# Altium schematic sheet Power-Sheet.SchDoc (part 2 of 3)
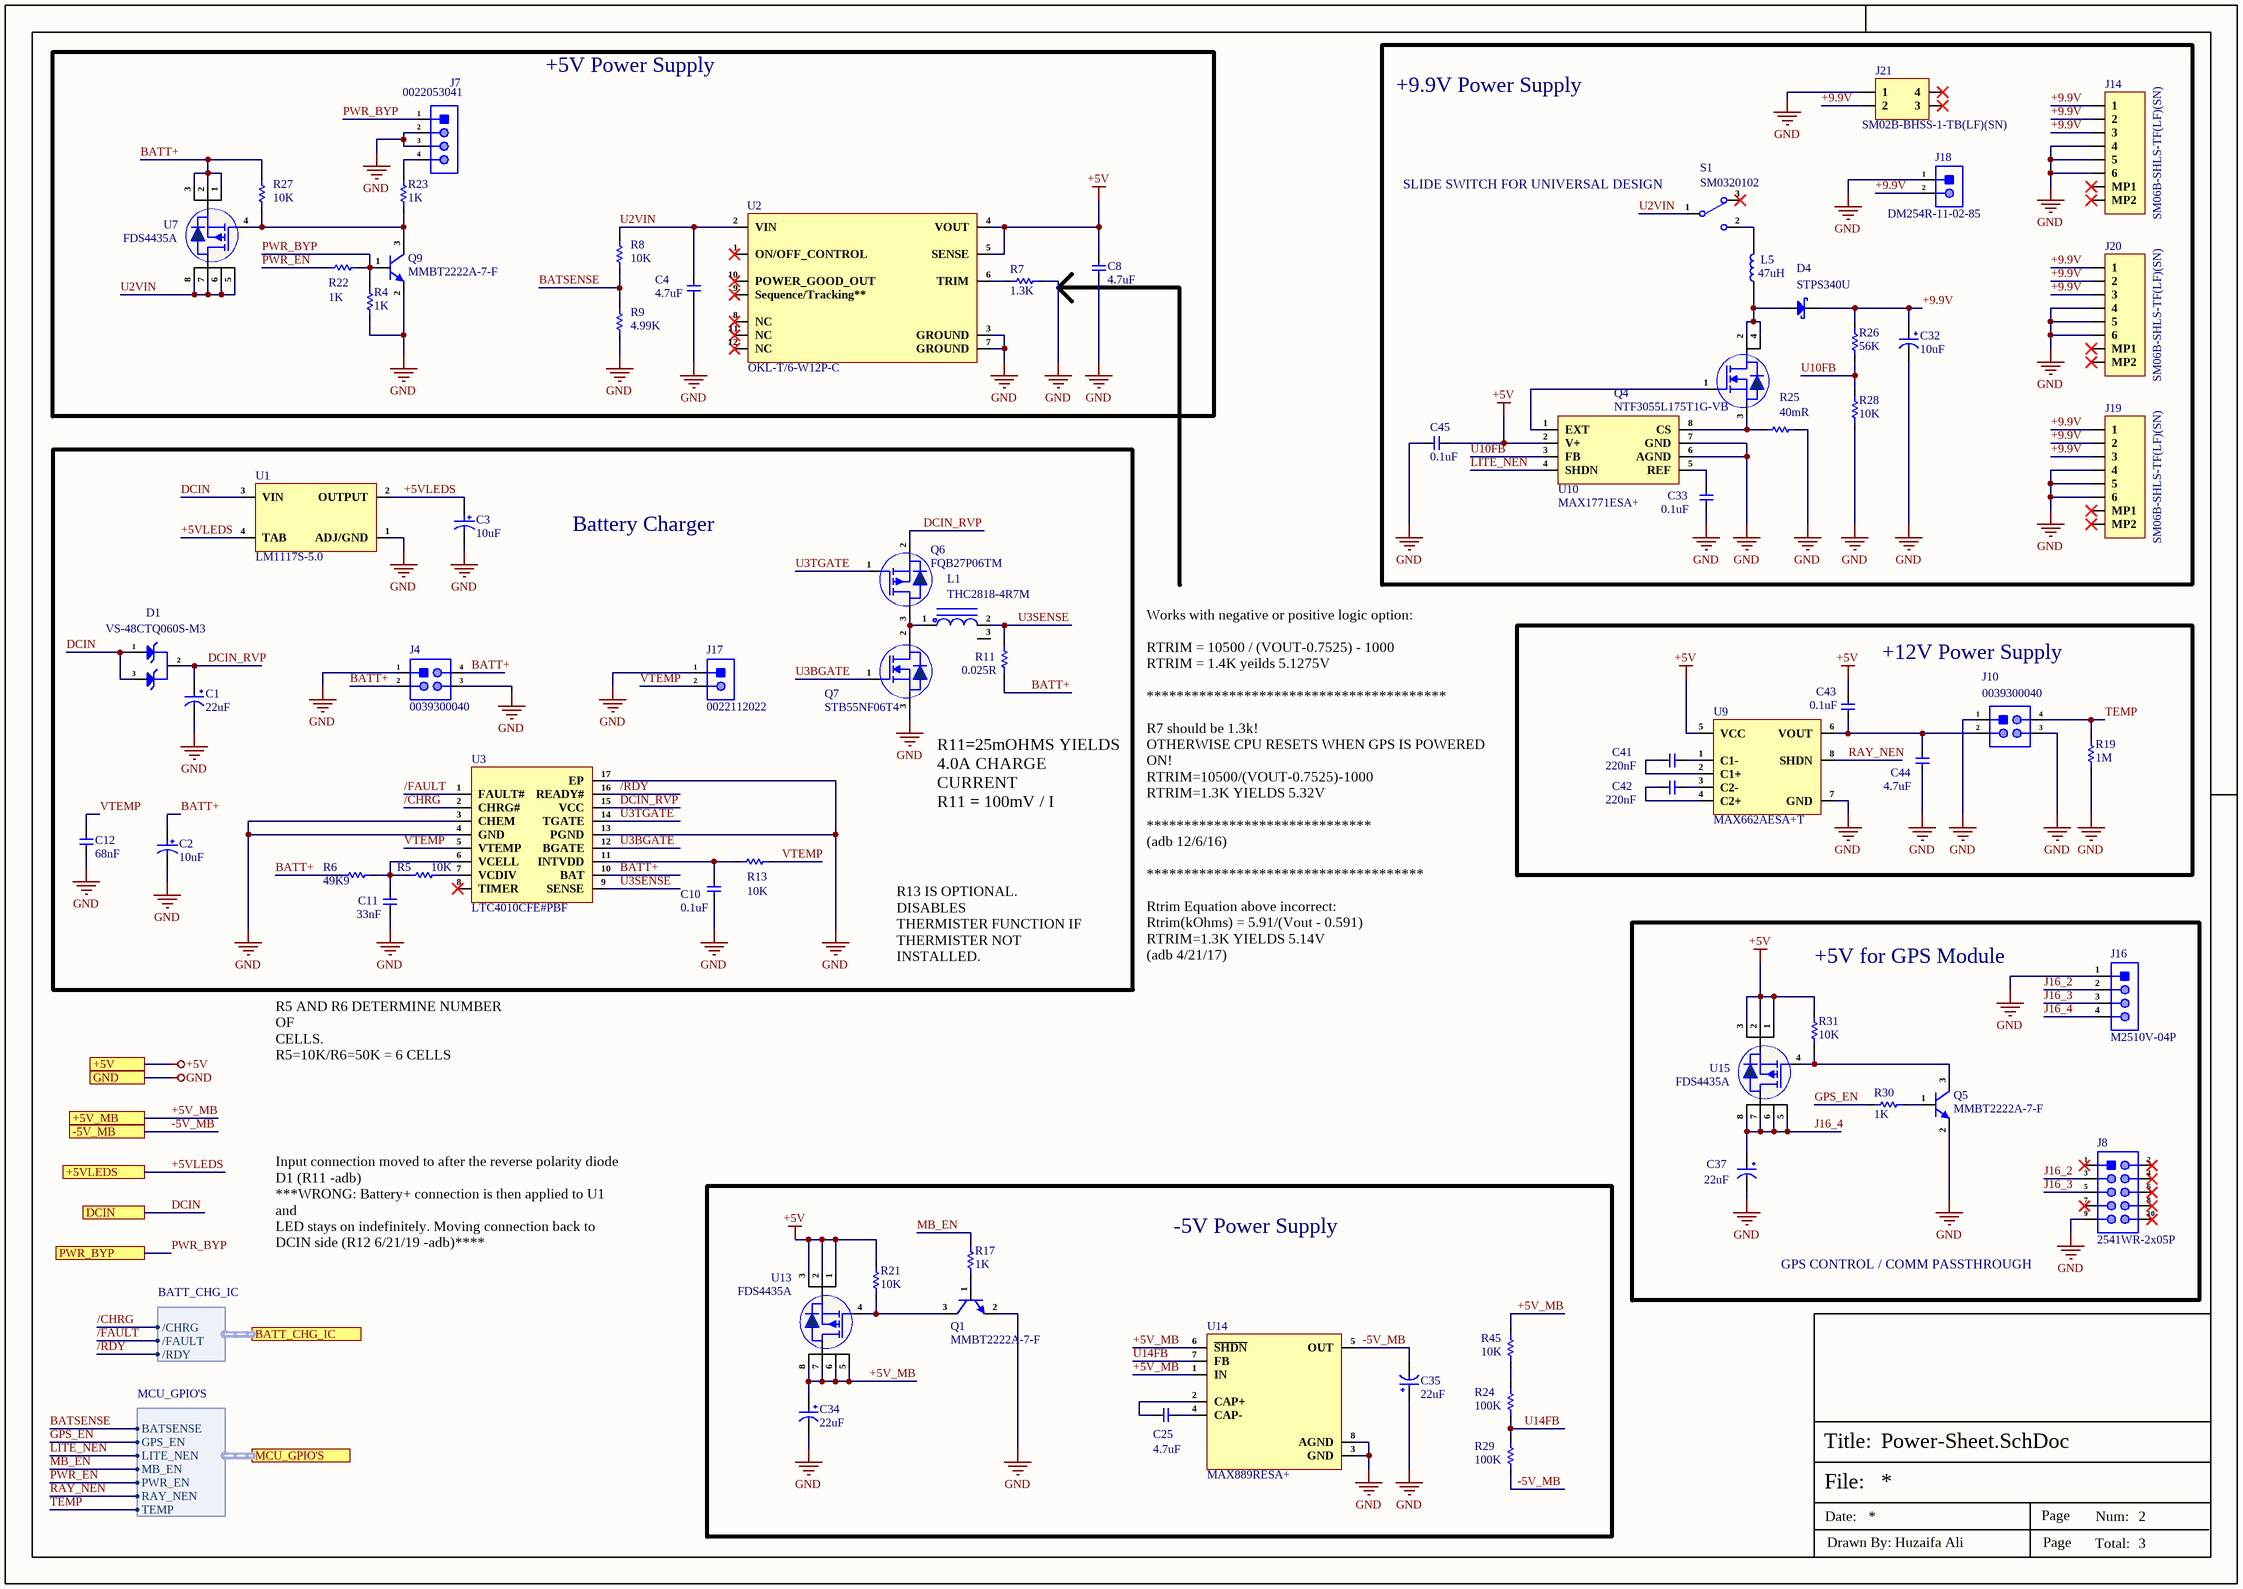
[diagram p1: Power-Sheet.SchDoc]
## Library data of the parts
C1 = TR3C226K025C0250: CAP TANT 22UF 10% 25V 2312; Manufacturer: Vishay Sprague; Item Type: Tantalum Capacitors; Supplier: Mouser; Supplier Part Number: 74-TR3C226K025C0250; Manufacturer Part Number: TR3C226K025C0250; RoHS: Yes; Stock: 217; Pricing: 1=1.45, 10=0.99, 50=0.99, 100=0.811, 1000=0.621, 10000=0.597 (USD); ComponentLink1URL: https://datasheet.ciiva.com/12911/tr3-239731-12911111.pdf?src-supplier=Mouser; ComponentLink1Description: https://datasheet.ciiva.com/12911/tr3-239731-12911111.pdf?src-supplier=Mouser; ComponentLink2URL: https://datasheet.ciiva.com/267/tr3-267103.pdf?src-supplier=Digikey; ComponentLink2Description: https://datasheet.ciiva.com/267/tr3-267103.pdf?src-supplier=Digikey; ComponentLink3URL: https://datasheet.ciiva.com/267/tr3-267104.pdf?src-supplier=Digikey; ComponentLink3Description: https://datasheet.ciiva.com/267/tr3-267104.pdf?src-supplier=Digikey; ComponentLink4URL: https://datasheet.ciiva.com/267/tr3-267105.pdf?src-supplier=Digikey; ComponentLink4Description: https://datasheet.ciiva.com/267/tr3-267105.pdf?src-supplier=Digikey; ComponentLink5URL: https://datasheet.ciiva.com/11299/tr3-11299414.pdf?src-supplier=Avnet; ComponentLink5Description: https://datasheet.ciiva.com/11299/tr3-11299414.pdf?src-supplier=Avnet; ComponentLink6URL: https://datasheet.ciiva.com/22731/1923401-22731838.pdf?src-supplier=Element14; ComponentLink6Description: https://datasheet.ciiva.com/22731/1923401-22731838.pdf?src-supplier=Element14; ComponentLink7URL: https://datasheet.ciiva.com/28445/1923401-28445770.pdf?src-supplier=Element14; ComponentLink7Description: https://datasheet.ciiva.com/28445/1923401-28445770.pdf?src-supplier=Element14
C2 C3 = CA45-B025K106T: 10uF 25V 2.5Ω@100kHz ±10% CASE-B-3528 Tantalum Capacitors ROHS; Manufacturer: Xiangyee in S&T; Manufacturer Part Number: CA45-B025K106T; ComponentLink1URL: https://www.lcsc.com/product-detail/Tantalum-Capacitors_Hunan-Xiangyee-in-S-T-CA45-B025K106T_C119050.html; ComponentLink1Description: LCSC; LCSC Part Number: C119050; Item Type: Capacitor; Package: Case-B
C4 C8 C25 C44 = C1608X5R1E475KT000E: CAP CER, 4.7 µF, 25 V, 0603; Manufacturer: TDK; Dielectric Material: Ceramic; Tolerance: 10%; Voltage Rating: 25V; Dielectric: X5R; Item Type: Capacitor; Supplier 1: Digi-Key; Manufacturer Part Number: C1608X5R1E475KT000E; RoHS: No; Supplier Part Number 1: 2220Y1000562GCT-ND; Supplier 2: RSComponents; Category: Ceramic Capacitors; Stock 2: 16120; Pricing 2: 100=0.23400, 200=0.21900, 1000=0.20700, 2000=0.18700 (GBP); Mount: Surface Mount; Case/Package: 0603; Weight: 7.1E-05oz; Case Code (Metric): 1608; Case Code (Imperial): 0603; Min Operating Temperature: -55°C; Max Operating Temperature: 85°C; Termination: SMD/SMT; Resistor Type: Ceramic; Packaging: Tape and Reel; Capacitance: 4.7uF; Package Quantity: 4000; Voltage Rating (DC): 25V; Length: 1.6mm; Width: 0.031inch; Height: 0.8mm; Thickness: 0.039inch; Depth: 0.8mm; Lead Free: Lead Free; REACH SVHC: No SVHC; ComponentLink1URL: https://datasheet.ciiva.com/48587/6print-detail-pdf-phplangenpart-noc1608x5r1e475k080acimp-unit-xmhz-48587141.pdf?src-supplier=Onlinecomponents.com; ComponentLink1Description: https://datasheet.ciiva.com/48587/6print-detail-pdf-phplangenpart-noc1608x5r1e475k080acimp-unit-xmhz-48587141.pdf?src-supplier=Onlinecomponents.com; ComponentLink2URL: https://datasheet.ciiva.com/24216/mlcc-commercial-general-en-24216326.pdf?src-supplier=Mouser; ComponentLink2Description: https://datasheet.ciiva.com/24216/mlcc-commercial-general-en-24216326.pdf?src-supplier=Mouser; ComponentLink3URL: https://datasheet.ciiva.com/48671/mlcc-commercial-general-en-48671304.pdf?src-supplier=Avnet; ComponentLink3Description: https://datasheet.ciiva.com/48671/mlcc-commercial-general-en-48671304.pdf?src-supplier=Avnet; Supplier Part Number 2: 9159158P; LCSC Part Number: C76615
C10 C33 C43 C45 = CC0603KRX7R0BB104: CAP CER 0.1UF 100V X7R 0603; Manufacturer: Yageo; Capacitance: 100nF; Tolerance: 10%; Item Type: Capacitor; Supplier 1: Digi-Key; Manufacturer Part Number: CC0603KRX7R0BB104; RoHS: Yes; Category: Ceramic Capacitors; Stock 1: 60476; Pricing 1: 1=0.19000, 10=0.13500, 50=0.07680, 100=0.06370, 500=0.04466, 1000=0.03696 (USD); Mount: Surface Mount; Case/Package: 0603; Case Code (Metric): 1608; Case Code (Imperial): 0603; Weight: 7.1E-05oz; Min Operating Temperature: -55°C; Max Operating Temperature: 125°C; Package Quantity: 4000; Voltage Rating: 100V; Packaging: Tape and Reel; Dielectric: X7R; Termination: SMD/SMT; Resistor Type: Ceramic; Voltage Rating (DC): 100V; Series: CC; Length: 0.063inch; Width: 0.031inch; Thickness: 0.035inch; Depth: 0.8mm; Lead Free: Lead Free; RoHS Compliant: Yes; ComponentLink1URL: https://datasheet.ciiva.com/6277/mlccorderingcode-6277030.pdf?src-supplier=Digi-Key; ComponentLink1Description: https://datasheet.ciiva.com/6277/mlccorderingcode-6277030.pdf?src-supplier=Digi-Key; ComponentLink2URL: https://datasheet.ciiva.com/6277/mlccorderingcode-6277081.pdf?src-supplier=Digi-Key; ComponentLink2Description: https://datasheet.ciiva.com/6277/mlccorderingcode-6277081.pdf?src-supplier=Digi-Key; ComponentLink3URL: https://datasheet.ciiva.com/6277/mlccorderingcode-6277082.pdf?src-supplier=Digi-Key; ComponentLink3Description: https://datasheet.ciiva.com/6277/mlccorderingcode-6277082.pdf?src-supplier=Digi-Key; Supplier Part Number 1: 311-1523-1-ND; LCSC Part Number: C113803
C11 = CL10B333KB8NNNC: CAP CER 0.033UF 50V X7R 0603; Manufacturer: Samsung; Material: Ceramic; Tolerance: 10%; Supplier: Avnet; Supplier Part Number: CL10B333KB8NNNC; Manufacturer Part Number: CL10B333KB8NNNC; RoHS: Yes; Category: Capacitors; Stock: 128000; Pricing: 4000=0.0055, 8000=0.00537, 16000=0.00525, 24000=0.00512, 32000=0.00499 (USD); Mounting Technology: Surface Mount; Case/Package: 0603; Case Code (Metric): 1608; Case Code (Imperial): 0603; Min Operating Temperature: -55°C; Max Operating Temperature: 125°C; Value: 33nF; Packaging: Tape and Reel; Package Quantity: 1; Voltage Rating: 50V; Dielectric: X7R; Series: CL; Construction: Flat; Voltage: 50V; Voltage Rating (DC): 50V; Length: 1.6mm; Width: 0.031inch; Height: 0.8mm; Thickness: 0.035inch; Depth: 0.8mm; Radiation Hardening: No; RoHS Compliant: Yes; ComponentLink1URL: https://datasheet.ciiva.com/15195/getdatasheetpartid-359558-15195751.pdf?src-supplier=Verical; ComponentLink1Description: https://datasheet.ciiva.com/15195/getdatasheetpartid-359558-15195751.pdf?src-supplier=Verical; ComponentLink2URL: https://datasheet.ciiva.com/29198/457066-da-01-en-vs-kondensator-0603-29198738.pdf?src-supplier=Conrad; ComponentLink2Description: https://datasheet.ciiva.com/29198/457066-da-01-en-vs-kondensator-0603-29198738.pdf?src-supplier=Conrad; ComponentLink3URL: https://datasheet.ciiva.com/16500/cl05b104kq5nnnc-16500696.pdf?src-supplier=Future+Electronics; ComponentLink3Description: https://datasheet.ciiva.com/16500/cl05b104kq5nnnc-16500696.pdf?src-supplier=Future+Electronics; ComponentLink4URL: https://datasheet.ciiva.com/26310/mlcc-catalogdownload2013-eng-26310287.pdf?src-supplier=Distrelec; ComponentLink4Description: https://datasheet.ciiva.com/26310/mlcc-catalogdownload2013-eng-26310287.pdf?src-supplier=Distrelec
C12 = CC0603KRX7R9BB683: CAP CER 0.068UF 50V X7R 0603; Manufacturer: Yageo; Item Type: Capacitors; Material: 4241ConductorMaterial; Tolerance: 10%; Supplier: Future Electronics; Supplier Part Number: 3015344; Manufacturer Part Number: CC0603KRX7R9BB683; RoHS: Yes; Stock: 52000; Pricing: 4000=0.0058, 16000=0.0055, 60000=0.0052, 160000=0.005, 400000=0.0047 (USD); Mounting Technology: Surface Mount; Case/Package: 0603; Case Code (Imperial): 0603; Case Code (Metric): 1608; Weight: 7.1E-05oz; Min Operating Temperature: -55°C; Max Operating Temperature: 125°C; Value: 68nF; Voltage Rating (DC): 50V; Packaging: Tape and Reel; Voltage Rating: 50V; Dielectric: X7R; Termination: SMD/SMT; Series: CC; Length: 0.063inch; Width: 0.031inch; Thickness: 0.035inch; Lead Free: Lead Free; Halogen Free: Halogen Free; RoHS Compliant: Yes; ComponentLink1URL: http://www.mouser.com/ds/2/447/Yageo_UPY-GP_NP0_16V-to-50V_9-358835.pdf?src-supplier=Mouser; ComponentLink1Description: http://www.mouser.com/ds/2/447/Yageo_UPY-GP_NP0_16V-to-50V_9-358835.pdf?src-supplier=Mouser; ComponentLink2URL: https://datasheet.octopart.com/CC0603KRX7R9BB683-Yageo-datasheet-166511530.pdf?src-supplier=Future+Electronics; ComponentLink2Description: https://datasheet.octopart.com/CC0603KRX7R9BB683-Yageo-datasheet-166511530.pdf?src-supplier=Future+Electronics; ComponentLink3URL: http://www.yageo.com/documents/recent/UPY-GPHC_X7R_6.3V-to-50V_18.pdf?src-supplier=Digikey; ComponentLink3Description: http://www.yageo.com/documents/recent/UPY-GPHC_X7R_6.3V-to-50V_18.pdf?src-supplier=Digikey; ComponentLink4URL: https://www.yageo.com/upload/media/product/productsearch/datasheet/mlcc/UPY-GPHC_X7R_6.3V-to-50V_18.pdf?src-supplier=Digikey; ComponentLink4Description: https://www.yageo.com/upload/media/product/productsearch/datasheet/mlcc/UPY-GPHC_X7R_6.3V-to-50V_18.pdf?src-supplier=Digikey; ComponentLink5URL: https://datasheet.octopart.com/CC0603KRX7R9BB683-Yageo-datasheet-140260305.pdf?src-supplier=Newark; ComponentLink5Description: https://datasheet.octopart.com/CC0603KRX7R9BB683-Yageo-datasheet-140260305.pdf?src-supplier=Newark; ComponentLink6URL: http://www.yageo.com/documents/recent/UPY-GPHC_X7R_6.3V-to-50V_9.pdf?src-supplier=Future+Electronics; ComponentLink6Description: http://www.yageo.com/documents/recent/UPY-GPHC_X7R_6.3V-to-50V_9.pdf?src-supplier=Future+Electronics; LCSC Part Number: C107098
C32 = TAJC106K035RNJ: CAP TANT 10UF 10% 35V 2312; Manufacturer: Kyocera AVX; Item Type: Tantalum Capacitors; Dielectric Material: Tantalum; Tolerance: 20%; ESR (Equivalent Series Resistance): 1.6R; Leakage Current: 3.5uA; Polarity: Polar; Voltage: 25V; Dissipation Factor: 6%; Life (Hours): 2000Hour; Ripple Current: 262mA; Supplier: Avnet; Supplier Part Number: TAJC106K035RNJ; Manufacturer Part Number: TAJC106K035RNJ; RoHS: Yes; Stock: 20000; Pricing: 500=0.4611, 1000=0.4505, 2000=0.4399, 3000=0.4293, 4000=0.4187, 5000=0.4081, 50000=0.4028 (USD); Mounting Technology: Surface Mount,PCB; Case/Package: Molded; Pins: 2; Case Code (Imperial): 2312; Case Code (Metric): 6032; Min Operating Temperature: -55°C; Max Operating Temperature: 125°C; Value: 10uF; Voltage Rating (DC): 35V; Voltage Rating: 35V; Features: General Purpose; Series: TAJ; Packaging: Tape and Reel; Package Quantity: 500; Termination: SMD/SMT; Construction: Flat; Length: 6mm; Width: 3.2mm; Height: 2.6mm; Depth: 3.2mm; Radiation Hardening: No; Lead Free: Lead Free; RoHS Compliant: Yes; Reach SVHC Compliant: No; ComponentLink1URL: https://datasheet.ciiva.com/11793/0900766b80ccdc61-11793205.pdf?src-supplier=Rs; ComponentLink1Description: https://datasheet.ciiva.com/11793/0900766b80ccdc61-11793205.pdf?src-supplier=Rs; ComponentLink2URL: https://datasheet.ciiva.com/26341/559442-da-01-en-tacc-c-6-0-mm-x-3-2-mm-x-2-6-mm-10-uf-26341782.pdf?src-supplier=Conrad; ComponentLink2Description: https://datasheet.ciiva.com/26341/559442-da-01-en-tacc-c-6-0-mm-x-3-2-mm-x-2-6-mm-10-uf-26341782.pdf?src-supplier=Conrad; ComponentLink3URL: https://datasheet.ciiva.com/5937/taj-5937099.pdf?src-supplier=Farnell; ComponentLink3Description: https://datasheet.ciiva.com/5937/taj-5937099.pdf?src-supplier=Farnell; ComponentLink4URL: https://datasheet.ciiva.com/7730/taj-7730983.pdf?src-supplier=Element14; ComponentLink4Description: https://datasheet.ciiva.com/7730/taj-7730983.pdf?src-supplier=Element14; ComponentLink5URL: https://datasheet.ciiva.com/7730/1703059-7730751.pdf?src-supplier=Element14; ComponentLink5Description: https://datasheet.ciiva.com/7730/1703059-7730751.pdf?src-supplier=Element14; ComponentLink6URL: https://datasheet.ciiva.com/7730/1703059-7730750.pdf?src-supplier=Element14; ComponentLink6Description: https://datasheet.ciiva.com/7730/1703059-7730750.pdf?src-supplier=Element14; ComponentLink7URL: https://datasheet.ciiva.com/7730/1680476-7730748.pdf?src-supplier=Element14; ComponentLink7Description: https://datasheet.ciiva.com/7730/1680476-7730748.pdf?src-supplier=Element14; ComponentLink8URL: https://datasheet.ciiva.com/7730/13070-7730749.pdf?src-supplier=Element14; ComponentLink8Description: https://datasheet.ciiva.com/7730/13070-7730749.pdf?src-supplier=Element14; ComponentLink9URL: https://datasheet.ciiva.com/264/taj-264350.pdf?src-supplier=Digikey; ComponentLink9Description: https://datasheet.ciiva.com/264/taj-264350.pdf?src-supplier=Digikey; ComponentLink10URL: https://datasheet.ciiva.com/264/taj-264349.pdf?src-supplier=Digikey; ComponentLink10Description: https://datasheet.ciiva.com/264/taj-264349.pdf?src-supplier=Digikey; ComponentLink11URL: https://datasheet.ciiva.com/264/taj-264351.pdf?src-supplier=Digikey; ComponentLink11Description: https://datasheet.ciiva.com/264/taj-264351.pdf?src-supplier=Digikey; ComponentLink12URL: https://datasheet.ciiva.com/12911/taj-27497-12911561.pdf?src-supplier=Mouser; ComponentLink12Description: https://datasheet.ciiva.com/12911/taj-27497-12911561.pdf?src-supplier=Mouser; ComponentLink13URL: https://datasheet.ciiva.com/14590/70001050-14590313.pdf?src-supplier=Allied+Electronics; ComponentLink13Description: https://datasheet.ciiva.com/14590/70001050-14590313.pdf?src-supplier=Allied+Electronics; ComponentLink14URL: https://datasheet.ciiva.com/3004/taj-3004476.pdf?src-supplier=Avnet; ComponentLink14Description: https://datasheet.ciiva.com/3004/taj-3004476.pdf?src-supplier=Avnet; ComponentLink15URL: https://datasheet.ciiva.com/15163/getdatasheetpartid-110753-15163367.pdf?src-supplier=Verical; ComponentLink15Description: https://datasheet.ciiva.com/15163/getdatasheetpartid-110753-15163367.pdf?src-supplier=Verical; ComponentLink16URL: https://datasheet.ciiva.com/3004/taj-3004475.pdf?src-supplier=Avnet; ComponentLink16Description: https://datasheet.ciiva.com/3004/taj-3004475.pdf?src-supplier=Avnet; LCSC Part Number: C7211
C34 C35 C37 = TAJB226K016RNJ: CAP TANT 22UF 10% 16V 1411; Manufacturer: Kyocera AVX; Item Type: Tantalum Capacitor; Manufacturer Part Number: TAJB226K016RNJ; Package: CASE-B-3528; LCSC Part Number: C8020; ComponentLink1Description: LCSC; ComponentLink1URL: https://www.lcsc.com/product-detail/Tantalum-Capacitors_Kyocera-AVX-TAJB226K016RNJ_C8020.html
C41 C42 = CC0603KRX7R6BB224: CAP CER 0.22UF 10V X7R 0603; Manufacturer: Yageo; Item Type: Capacitor; Supplier: Future Electronics; Supplier Part Number: 4740247; Manufacturer Part Number: CC0603KRX7R6BB224; RoHS: Yes; Category: Ceramic Capacitors; Stock: 892000; Pricing: 4000=0.0074, 16000=0.0071, 60000=0.0067, 100000=0.0066, 200000=0.0062 (USD); ComponentLink1URL: https://datasheet.ciiva.com/11786/0900766b80ce67ed-11786433.pdf?src-supplier=Rs; ComponentLink1Description: https://datasheet.ciiva.com/11786/0900766b80ce67ed-11786433.pdf?src-supplier=Rs; ComponentLink2URL: https://datasheet.ciiva.com/15189/getdatasheetpartid-93657-15189159.pdf?src-supplier=Verical; ComponentLink2Description: https://datasheet.ciiva.com/15189/getdatasheetpartid-93657-15189159.pdf?src-supplier=Verical; ComponentLink3URL: https://datasheet.ciiva.com/144/mlccorderingcode-144664.pdf?src-supplier=Digi-Key; ComponentLink3Description: https://datasheet.ciiva.com/144/mlccorderingcode-144664.pdf?src-supplier=Digi-Key; ComponentLink4URL: https://datasheet.ciiva.com/144/mlccorderingcode-144665.pdf?src-supplier=Digi-Key; ComponentLink4Description: https://datasheet.ciiva.com/144/mlccorderingcode-144665.pdf?src-supplier=Digi-Key; ComponentLink5URL: https://datasheet.ciiva.com/144/mlccorderingcode-144666.pdf?src-supplier=Digi-Key; ComponentLink5Description: https://datasheet.ciiva.com/144/mlccorderingcode-144666.pdf?src-supplier=Digi-Key; ComponentLink6URL: https://datasheet.ciiva.com/8033/1489800-8033791.pdf?src-supplier=Element14; ComponentLink6Description: https://datasheet.ciiva.com/8033/1489800-8033791.pdf?src-supplier=Element14; ComponentLink7URL: https://datasheet.ciiva.com/7978/1489800-7978173.pdf?src-supplier=Element14; ComponentLink7Description: https://datasheet.ciiva.com/7978/1489800-7978173.pdf?src-supplier=Element14; ComponentLink8URL: https://datasheet.ciiva.com/11464/upy-gphc-x7r-6-3v-to-50v-8-11464734.pdf?src-supplier=Avnet; ComponentLink8Description: https://datasheet.ciiva.com/11464/upy-gphc-x7r-6-3v-to-50v-8-11464734.pdf?src-supplier=Avnet; LCSC Part Number: C106216
D1 = VS-48CTQ060S-M3: DIODE ARR SCHOTT 60V 20A TO263AB; Manufacturer: Vishay Semiconductors; Item Type: Rectifier Diodes; Supplier: Mouser; Supplier Part Number: 78-VS-48CTQ060S-M3; Manufacturer Part Number: VS-48CTQ060S-M3; RoHS: Yes; Stock: 5641; Pricing: 1=2.03, 10=1.62, 50=1.62, 100=1.35, 1000=0.906, 10000=0.869 (USD); Mounting Technology: Surface Mount; Case/Package: TO-263-3; Packaging: Rail/Tube; Average Rectified Current: 20A; Max Reverse Voltage (DC): 60V; Series: -; RoHS Compliant: Yes; ComponentLink1URL: http://www.vishay.com/docs/94944/vs-48ctq060s-m3.pdf?src-supplier=Digikey; ComponentLink1Description: http://www.vishay.com/docs/94944/vs-48ctq060s-m3.pdf?src-supplier=Digikey
D4 = STPS340U: 40V 3A 570mV SMB Schottky Barrier Diodes (SBD) ROHS; Manufacturer: Tokmas; Item Type: Diode; Manufacturer Part Number: STPS340U; Package: SMB; LCSC Part Number: C5377821; ComponentLink1Description: LCSC; ComponentLink1URL: https://www.lcsc.com/product-detail/Schottky-Barrier-Diodes-SBD_Tokmas-STPS340U_C5377821.html
J4 J10 = 0039300040: CONN HEADER R/A 4POS 4.2MM; Manufacturer: Molex; Item Type: Headers and Wire Housings; Supplier: Mouser; Supplier Part Number: 538-39-30-0040; Manufacturer Part Number: 39-30-0040; RoHS: Yes; Stock: 15606; Pricing: 1=0.89, 10=0.754, 50=0.754, 100=0.681, 1000=0.608, 10000=0.53 (USD); ComponentLink1URL: https://datasheet.ciiva.com/5149/0039300040-pcb-headers-140142-5149121.pdf?src-supplier=Mouser; ComponentLink1Description: https://datasheet.ciiva.com/5149/0039300040-pcb-headers-140142-5149121.pdf?src-supplier=Mouser; ComponentLink2URL: https://datasheet.ciiva.com/11753/0900766b80d5d5b2-11753001.pdf?src-supplier=Rs; ComponentLink2Description: https://datasheet.ciiva.com/11753/0900766b80d5d5b2-11753001.pdf?src-supplier=Rs; ComponentLink3URL: https://datasheet.ciiva.com/26921/getdatasheetpartid-168591-26921980.pdf?src-supplier=Verical; ComponentLink3Description: https://datasheet.ciiva.com/26921/getdatasheetpartid-168591-26921980.pdf?src-supplier=Verical; ComponentLink4URL: https://datasheet.ciiva.com/30077/32250039300040-pcb-headers-30077452.pdf?src-supplier=Onlinecomponents.com; ComponentLink4Description: https://datasheet.ciiva.com/30077/32250039300040-pcb-headers-30077452.pdf?src-supplier=Onlinecomponents.com; ComponentLink5URL: https://datasheet.ciiva.com/17018/70266946-17018007.pdf?src-supplier=Allied+Electronics; ComponentLink5Description: https://datasheet.ciiva.com/17018/70266946-17018007.pdf?src-supplier=Allied+Electronics; ComponentLink6URL: https://datasheet.ciiva.com/1443/1707493-1443179.pdf?src-supplier=Element14; ComponentLink6Description: https://datasheet.ciiva.com/1443/1707493-1443179.pdf?src-supplier=Element14; LCSC Part Number: C234187
J7 = 0022053041: CONN HEADER R/A 4POS 2.54MM; Manufacturer: Molex; Item Type: Wire To Board Connector; Supplier: Mouser; Supplier Part Number: 538-22-05-3041; Manufacturer Part Number: 0022053041; RoHS: Yes; Stock: 11241; Pricing: 1=0.53, 10=0.383, 50=0.383, 100=0.327, 1000=0.273, 10000=0.266 (USD); ComponentLink1URL: https://www.molex.com/pdm_docs/sd/022053041_sd.pdf?src-supplier=Digikey; ComponentLink1Description: https://www.molex.com/pdm_docs/sd/022053041_sd.pdf?src-supplier=Digikey; LCSC Part Number: C98739
J8 = 2541WR-2x05P: Right-Angle 2.5mm 6mm 10P 2.54mm 双排 2x5P Plugin,P=2.54mm Pin Headers ROHS; Manufacturer: HanElectricity; Manufacturer Part Number: 2541WR-2x05P; Package: Plugin,P=2.54mm; LCSC Part Number: C5383090; Item Type: Pin Header; ComponentLink1Description: LCSC; ComponentLink1URL: https://www.lcsc.com/product-detail/Pin-Headers_HanElectricity-2541WR-2x05P_C5383090.html
J14 J19 J20 = SM06B-SHLS-TF(LF)(SN): CONN HEADER SMD R/A 6POS 1MM; Manufacturer: JST; Item Type: Headers and Wire Housings; Number of Contacts: 6NUMBER; Supplier: Future Electronics; Supplier Part Number: 3248077; Manufacturer Part Number: SM06B-SHLS-TF(LF)(SN); RoHS: Yes; Stock: 18000; Pricing: 4500=0.375 (USD); ComponentLink1URL: https://datasheet.ciiva.com/16213/sm06b-shls-tflfsn-16213701.pdf?src-supplier=Future+Electronics; ComponentLink1Description: https://datasheet.ciiva.com/16213/sm06b-shls-tflfsn-16213701.pdf?src-supplier=Future+Electronics; LCSC Part Number: C265110
J16 = M2510V-04P: 1x4P 1 2.54mm Male pin 4 -25℃~+85℃ 3A Straight Plugin,P=2.54mm Wire To Board / Wire To Wire Connector ROHS; Manufacturer: XFCN; Item Type: Wire To Board Connector; Manufacturer Part Number: M2510V-04P; Package: Plugin,P=2.54mm; LCSC Part Number: C2764792; ComponentLink1Description: LCSC; ComponentLink1URL: https://www.lcsc.com/product-detail/Wire-To-Board-Wire-To-Wire-Connector_XFCN-M2510V-04P_C2764792.html
J17 = 0022112022: CONN HEADER VERT 2POS 2.54MM; Manufacturer: Molex; Item Type: Headers, Male Pins; Supplier: Mouser; Supplier Part Number: 538-22-11-2022; Manufacturer Part Number: 0022112022; RoHS: Yes; Stock: 67872; Pricing: 1=0.4, 10=0.274, 50=0.274, 100=0.216, 1000=0.177, 10000=0.169 (USD); ComponentLink1URL: https://www.molex.com/pdm_docs/sd/022112022_sd.pdf?src-supplier=Digikey; ComponentLink1Description: https://www.molex.com/pdm_docs/sd/022112022_sd.pdf?src-supplier=Digikey; LCSC Part Number: C505162
J18 = DM254R-11-02-85: 2.54mm Plugin 3A 2P Straight 1x2P 8.5mm Top Square Holes Plugin,P=2.54mm Female Headers ROHS; Manufacturer: DEALON; Item Type: Header; Manufacturer Part Number: DM254R-11-02-85; Package: Plugin,P=2.54mm; LCSC Part Number: C2935973; ComponentLink1Description: LCSC; ComponentLink1URL: https://www.lcsc.com/product-detail/span-style-background-color-ff0-Female-span-Headers_DEALON-DM254R-11-02-85_C2935973.html
J21 = SM02B-BHSS-1-TB(LF)(SN): CONN HEADER SMD R/A 2POS 3.5MM; Manufacturer: JST; Item Type: Headers and Wire Housings; Supplier: Future Electronics; Supplier Part Number: 5605704; Manufacturer Part Number: SM02B-BHSS-1-TB(LF)(SN); RoHS: Yes; Stock: 10000; Pricing: 1000=0.67, 2000=0.655, 3000=0.645, 4000=0.635 (USD); ComponentLink1URL: https://datasheet.ciiva.com/26894/getdatasheetpartid-651429-26894666.pdf?src-supplier=Verical; ComponentLink1Description: https://datasheet.ciiva.com/26894/getdatasheetpartid-651429-26894666.pdf?src-supplier=Verical; ComponentLink2URL: https://datasheet.ciiva.com/16394/sm02b-bhss-1-tblfsn-16394674.pdf?src-supplier=Future+Electronics; ComponentLink2Description: https://datasheet.ciiva.com/16394/sm02b-bhss-1-tblfsn-16394674.pdf?src-supplier=Future+Electronics; LCSC Part Number: C485339
L1 = THC2818-4R7M: 28A 4.7uH ±20% 61.2A 2.6mΩ SMD-3P,19.7x27.9mm Inductors (SMD) ROHS; Manufacturer: KOHERelec; Manufacturer Part Number: THC2818-4R7M; Package: SMD-3P,19.7x27.9mm; LCSC Part Number: C2761984; Item Type: Inductors; ComponentLink1Description: LCSC; ComponentLink1URL: https://www.lcsc.com/product-detail/Inductors-SMD_KOHERelec-THC2818-4R7M_C2761984.html
L5 = SMMS1050-470M: 3A 47uH Molding Choke ±20% 4.5A SMD Power Inductors ROHS; Manufacturer: SXN; Footprint: SMD; Manufacturer Part Number: SMMS1050-470M; Value: 47uH; LCSC Part Number: C149548; ComponentLink1Description: LCSC; ComponentLink1URL: https://www.lcsc.com/product-detail/Power-Inductors_SXN-Shun-Xiang-Nuo-Elec-SMMS1050-470M_C149548.html
Q1 Q5 Q9 = MMBT2222A-7-F: TRANS NPN 40V 0.6A SMD SOT23-3; Manufacturer: Diodes; Max Power Dissipation: 300mW; Collector Base Voltage (VCBO): 75V; Max Collector Current: 600mA; hFE Min: 100; Frequency: 300MHz; Number of Elements: 1; Emitter Base Voltage (VEBO): 6V; Collector Emitter Saturation Voltage: 1V; Power Dissipation: 350mW; Element Configuration: Single; Current: 1A; Item Type: Mosfet; Supplier 1: Digi-Key; Manufacturer Part Number: MMBT2222A-7-F; Stock 1: 2471182; Pricing 1: 1=0.15, 10=0.134, 100=0.0729, 500=0.04486, 1000=0.03059 (USD); Mount: Surface Mount; Case/Package: SOT-23; Number of Pins: 3; Weight: 0.000282oz; Contact Plating: Matte,Tin; Min Operating Temperature: -55°C; Max Operating Temperature: 150°C; Packaging: Tape and Reel; Collector Emitter Voltage (VCEO): 40V; Polarity: NPN; Voltage Rating (DC): 40V; Package Quantity: 3000; Continuous Collector Current: 600mA; Collector Emitter Breakdown Voltage: 40V; Transition Frequency: 300MHz; Max Breakdown Voltage: 40V; Max Frequency: 300MHz; Termination: SMD/SMT; Gain Bandwidth Product: 300MHz; Current Rating: 600mA; Voltage: 40V; Length: 3.05mm; Height: 1mm; Width: 1.4mm; Radiation Hardening: No; Lead Free: Lead Free; REACH SVHC: No SVHC; ComponentLink1URL: http://www.diodes.com/datasheets/ds30041.pdf?src-supplier=Future+Electronics; ComponentLink1Description: http://www.diodes.com/datasheets/ds30041.pdf?src-supplier=Future+Electronics; ComponentLink2URL: http://www.diodes.com/datasheets/ds30041.pdf?src-supplier=Avnet; ComponentLink2Description: http://www.diodes.com/datasheets/ds30041.pdf?src-supplier=Avnet; ComponentLink3URL: https://www.verical.com/server-webapp/html/getDatasheet?partID=82692&src-supplier=Verical; ComponentLink3Description: https://www.verical.com/server-webapp/html/getDatasheet?partID=82692&src-supplier=Verical; ComponentLink4URL: https://www.diodes.com/assets/Datasheets/ds30041.pdf?src-supplier=Digi-Key; ComponentLink4Description: https://www.diodes.com/assets/Datasheets/ds30041.pdf?src-supplier=Digi-Key; ComponentLink5URL: http://www.diodes.com/datasheets/ds30041.pdf?src-supplier=Avnet+Europe; ComponentLink5Description: http://www.diodes.com/datasheets/ds30041.pdf?src-supplier=Avnet+Europe; ComponentLink6URL: http://www.diodes.com/datasheets/ds30041.pdf?src-supplier=Element14; ComponentLink6Description: http://www.diodes.com/datasheets/ds30041.pdf?src-supplier=Element14; Supplier Part Number 1: MMBT2222A-FDIDKR-ND; LCSC Part Number: C94515
Q4 = NTF3055L175T1G-VB: 60V 4A 1PCSNChannel SOT-223 MOSFETs ROHS; Manufacturer: VBsemi Elec; Item Type: MOSFET; Manufacturer Part Number: NTF3055L175T1G-VB; Package: SOT-223; LCSC Part Number: C7494559; ComponentLink1Description: LCSC; ComponentLink1URL: https://www.lcsc.com/product-detail/MOSFETs_VBsemi-Elec-NTF3055L175T1G-VB_C7494559.html
Q6 = FQB27P06TM: MOSFET P-CH 60V 27A D2PAK; Manufacturer: ON Semiconductor / Fairchild; Item Type: MOSFETs; Supplier: Digikey; Supplier Part Number: FQB27P06TMCT-ND; Manufacturer Part Number: FQB27P06TM; RoHS: Yes; Stock: 2039; Pricing: 1=1.97, 10=1.634, 100=1.3003 (USD); ComponentLink1URL: https://datasheet.ciiva.com/6037/1781179-6037411.pdf?src-supplier=Farnell; ComponentLink1Description: https://datasheet.ciiva.com/6037/1781179-6037411.pdf?src-supplier=Farnell; ComponentLink2URL: https://datasheet.ciiva.com/15137/getdatasheetpartid-95969-15137803.pdf?src-supplier=Verical; ComponentLink2Description: https://datasheet.ciiva.com/15137/getdatasheetpartid-95969-15137803.pdf?src-supplier=Verical; ComponentLink3URL: https://datasheet.ciiva.com/4441/fqb27p06-109865-4441954.pdf?src-supplier=Mouser; ComponentLink3Description: https://datasheet.ciiva.com/4441/fqb27p06-109865-4441954.pdf?src-supplier=Mouser; ComponentLink4URL: https://datasheet.ciiva.com/1256/1729188-1256195.pdf?src-supplier=Newark; ComponentLink4Description: https://datasheet.ciiva.com/1256/1729188-1256195.pdf?src-supplier=Newark; ComponentLink5URL: https://datasheet.ciiva.com/6382/fqb27p06-6382008.pdf?src-supplier=Digikey; ComponentLink5Description: https://datasheet.ciiva.com/6382/fqb27p06-6382008.pdf?src-supplier=Digikey; ComponentLink6URL: https://datasheet.ciiva.com/6382/fqb27p06-6382011.pdf?src-supplier=Digikey; ComponentLink6Description: https://datasheet.ciiva.com/6382/fqb27p06-6382011.pdf?src-supplier=Digikey; ComponentLink7URL: https://datasheet.ciiva.com/22671/1781179-22671975.pdf?src-supplier=Element14; ComponentLink7Description: https://datasheet.ciiva.com/22671/1781179-22671975.pdf?src-supplier=Element14
Q7 = STB55NF06T4: MOSFET N-CH 60V 50A D2PAK; Manufacturer: STMicroelectronics; Item Type: MOSFETs; Supplier: Mouser; Supplier Part Number: 511-STB55NF06; Manufacturer Part Number: STB55NF06T4; RoHS: Yes; Stock: 5248; Pricing: 1=2.35, 10=1.97, 50=1.97, 100=1.58, 1000=1.1, 10000=1.05 (USD); Voltage Rating (DC): 60V; Current Rating: 50A; Lead Free: 5697LeadFree; ComponentLink1URL: https://datasheet.ciiva.com/4441/cd00002311-107743-4441381.pdf?src-supplier=Mouser; ComponentLink1Description: https://datasheet.ciiva.com/4441/cd00002311-107743-4441381.pdf?src-supplier=Mouser; ComponentLink2URL: https://datasheet.ciiva.com/17097/stb55nf06t4-17097567.pdf?src-supplier=Allied+Electronics; ComponentLink2Description: https://datasheet.ciiva.com/17097/stb55nf06t4-17097567.pdf?src-supplier=Allied+Electronics; ComponentLink3URL: https://datasheet.ciiva.com/16383/cd00002311-16383630.pdf?src-supplier=Future+Electronics; ComponentLink3Description: https://datasheet.ciiva.com/16383/cd00002311-16383630.pdf?src-supplier=Future+Electronics; ComponentLink4URL: https://datasheet.ciiva.com/938/cd00002311-938375.pdf?src-supplier=Digikey; ComponentLink4Description: https://datasheet.ciiva.com/938/cd00002311-938375.pdf?src-supplier=Digikey; ComponentLink5URL: https://datasheet.ciiva.com/938/cd00002311-938376.pdf?src-supplier=Digikey; ComponentLink5Description: https://datasheet.ciiva.com/938/cd00002311-938376.pdf?src-supplier=Digikey; LCSC Part Number: C472532
R4 R17 R22 R23 R30 = RC0603FR-071KL: RES SMD 1K OHM 1% 1/10W 0603; Manufacturer: Yageo; Resistance: 1kR; Temperature Coefficient: 100ppm/°C; Power Rating: 100mW; Voltage Rating: 50V; Item type: Resistor; ComponentLink1URL: https://www.verical.com/server-webapp/html/getDatasheet?partID=409289&src-supplier=Verical; ComponentLink1Description: https://www.verical.com/server-webapp/html/getDatasheet?partID=409289&src-supplier=Verical; Supplier 1: Digi-Key; Manufacturer Part Number: RC0603FR-071KL; Stock 1: 21472395; Pricing 1: 1=0.1, 10=0.023, 100=0.0094, 1000=0.0042, 2500=0.0037 (USD); Case/Package: 0603; Contact Plating: Tin,Matte; Case Code (Imperial): 0603; Case Code (Metric): 1608; Min Operating Temperature: -55°C; Max Operating Temperature: 155°C; Tolerance: 1%; Composition: Thick Film; Packaging: Tape and Reel; Termination: SMD/SMT; Military Standard: Not; Length: 1.6mm; Height: 0.45mm; Depth: 0.8mm; Radiation Hardening: No; REACH SVHC: No SVHC; Lead Free: Lead Free; ComponentLink2URL: http://documents.rs-components.com/techlib://itc_doclist_GB.htm?stockno=5048928&src-supplier=RSComponents; ComponentLink2Description: http://documents.rs-components.com/techlib://itc_doclist_GB.htm?stockno=5048928&src-supplier=RSComponents; ComponentLink3URL: http://www.yageo.com/documents/recent/PYu-RC0603_51_RoHS_L_4.pdf?src-supplier=Avnet+Europe; ComponentLink3Description: http://www.yageo.com/documents/recent/PYu-RC0603_51_RoHS_L_4.pdf?src-supplier=Avnet+Europe; ComponentLink4URL: http://www.farnell.com/datasheets/2167052.pdf?src-supplier=Element14; ComponentLink4Description: http://www.farnell.com/datasheets/2167052.pdf?src-supplier=Element14; ComponentLink5URL: http://www.farnell.com/datasheets/1868787.pdf?src-supplier=Element14; ComponentLink5Description: http://www.farnell.com/datasheets/1868787.pdf?src-supplier=Element14; ComponentLink6URL: http://www.yageo.com/documents/recent/PYu-RC_Group_51_RoHS_L_2.pdf?src-supplier=Avnet; ComponentLink6Description: http://www.yageo.com/documents/recent/PYu-RC_Group_51_RoHS_L_2.pdf?src-supplier=Avnet; ComponentLink7URL: https://www.verical.com/server-webapp/html/getDatasheet?partID=404327&src-supplier=Verical; ComponentLink7Description: https://www.verical.com/server-webapp/html/getDatasheet?partID=404327&src-supplier=Verical; ComponentLink8URL: http://www.farnell.com/datasheets/443971.pdf?src-supplier=Element14; ComponentLink8Description: http://www.farnell.com/datasheets/443971.pdf?src-supplier=Element14; Supplier Part Number 1: 311-1.00KHRDKR-ND; LCSC Part Number: C22548
R5 R8 R13 R21 R27 R28 R31 R45 = RT0603BRD0710KL: RES SMD 10K OHM 0.1% 1/10W 0603; Manufacturer: Yageo; Power: 100mW; Rated Temperature: 70°C; Value: 10kR; Temperature Coefficient: 25ppm/°C; Working Voltage: 75V; Package Height: 0.45mm; Package Length: 1.6mm; Package Width: 0.8mm; Item Type: Resistor; Supplier 1: Rs; Manufacturer Part Number: RT0603BRD0710KL; RoHS: Yes; Category: Chip SMD Resistors; Stock 1: 20510; Pricing 1: 100=0.29800, 250=0.27800, 500=0.25900, 1000=0.23700 (GBP); Mounting Technology: Surface Mount; Pins: 2; Case/Package: 0603; Min Operating Temperature: -55°C; Max Operating Temperature: 155°C; Tolerance: 0.1%; Resistor Type: FIXED RESISTOR; Construction: Chip; Package Style: SMTMeter; Packaging: Tape and Reel; Technology: THIN FILM; Termination: Wraparound; Reach SVHC Compliant: Yes; RoHS Compliant: Yes; ComponentLink1URL: https://datasheet.ciiva.com:443/pdfs/VipMasterIC/IC/YAGO/YAGO-S-A0008510989/YAGO-S-A0008510989-1.pdf?src-supplier=IHS+Markit; ComponentLink1Description: https://datasheet.ciiva.com:443/pdfs/VipMasterIC/IC/YAGO/YAGO-S-A0008510989/YAGO-S-A0008510989-1.pdf?src-supplier=IHS+Markit; ComponentLink2URL: https://datasheet.ciiva.com/5624/pyu-rt-1-to-0-05-rohs-l-4-5624351.pdf?src-supplier=Mouser; ComponentLink2Description: https://datasheet.ciiva.com/5624/pyu-rt-1-to-0-05-rohs-l-4-5624351.pdf?src-supplier=Mouser; ComponentLink3URL: https://datasheet.ciiva.com/29721/pyu-rt-1-to-0-05-rohs-l-4-29721177.pdf?src-supplier=Digi-Key; ComponentLink3Description: https://datasheet.ciiva.com/29721/pyu-rt-1-to-0-05-rohs-l-4-29721177.pdf?src-supplier=Digi-Key; Supplier Part Number 1: 1991391P; LCSC Part Number: C95204
R6 = RC0603FR-0749K9L: RES 49.9K OHM 1% 1/10W 0603; Manufacturer: Yageo; Power Rating: 100mW; Resistance: 49.9kR; Temperature Coefficient: 100ppm/°C; Voltage Rating (DC): 50V; Item Type: Resistor; Supplier 1: Digi-Key; Manufacturer Part Number: RC0603FR-0749K9L; RoHS: Yes; Category: Chip SMD Resistors; Stock 1: 77863; Pricing 1: 1=0.10000, 10=0.02400, 100=0.00970, 1000=0.00436, 2500=0.00378 (USD); Mount: Surface Mount; Case/Package: 0603; Case Code (Metric): 1608; Case Code (Imperial): 0603; Size Code: 0603; Min Operating Temperature: -55°C; Max Operating Temperature: 155°C; Tolerance: 1%; Packaging: Tape and Reel; Package Quantity: 1; Voltage Rating: 50V; Resistor Type: Thick Film; Number of Terminations: 2; Termination: SMD/SMT; Max Power Dissipation: 100mW; Features: Moisture Resistant; Series: RC; Construction: Rectangular; Length: 0.063inch; Width: 0.031inch; Height: 0.022inch; Depth: 0.8mm; Lead Free: Lead Free; Military Standard: Not; RoHS Compliant: Yes; ComponentLink1URL: https://datasheet.ciiva.com/2454/pyu-r-int-thick-7-2454042.pdf?src-supplier=Digi-Key; ComponentLink1Description: https://datasheet.ciiva.com/2454/pyu-r-int-thick-7-2454042.pdf?src-supplier=Digi-Key; ComponentLink2URL: https://datasheet.ciiva.com/2454/pyu-r-int-thick-7-2454043.pdf?src-supplier=Digi-Key; ComponentLink2Description: https://datasheet.ciiva.com/2454/pyu-r-int-thick-7-2454043.pdf?src-supplier=Digi-Key; ComponentLink3URL: https://datasheet.ciiva.com/2454/pyu-r-int-thick-7-2454044.pdf?src-supplier=Digi-Key; ComponentLink3Description: https://datasheet.ciiva.com/2454/pyu-r-int-thick-7-2454044.pdf?src-supplier=Digi-Key; ComponentLink4URL: https://datasheet.ciiva.com/15189/getdatasheetpartid-323805-15189749.pdf?src-supplier=Verical; ComponentLink4Description: https://datasheet.ciiva.com/15189/getdatasheetpartid-323805-15189749.pdf?src-supplier=Verical; Supplier Part Number 1: 311-49.9KHRCT-ND; LCSC Part Number: C114624
R7 = 0603WAF1301T5E: 100mW Thick Film Resistors 75V ±100ppm/℃ ±1% 1.3kΩ 0603 Chip Resistor - Surface Mount ROHS; Manufacturer: UNI-ROYAL; Manufacturer Part Number: 0603WAF1301T5E; Package: 0603; LCSC Part Number: C22767; Item Type: Resistor; ComponentLink1Description: LCSC; ComponentLink1URL: https://www.lcsc.com/product-detail/Chip-Resistor-Surface-Mount_UNI-ROYAL-Uniroyal-Elec-0603WAF1301T5E_C22767.html
R9 = 0603WAF4991T5E: 100mW Thick Film Resistors ±100ppm/℃ ±1% 1MΩ 0603 Chip Resistor - Surface Mount ROHS; Manufacturer: UNI-ROYAL(Uniroyal Elec); Manfacturer Part Number: 0603WAF4991T5E; LCSC Part Number: C23046; Package: 0603; Item Type: Resistor; ComponentLink1Description: LCSC; ComponentLink1URL: https://www.lcsc.com/product-detail/Chip-Resistor-Surface-Mount_UNI-ROYAL-Uniroyal-Elec-0603WAF4991T5E_C23046.html
R11 = WSL2512R0250FEA: RES 0.025 OHM 1% 1W 2512; Manufacturer: Vishay Dale; Item Type: Resistor; Value: 25mR; Voltage Rating: 150mV; Temperature Coefficient: 75ppm/°C; Supplier: Mouser; Supplier Part Number: 71-WSL2512R0250FEA; Manufacturer Part Number: WSL2512R0250FEA; RoHS: No; Stock: 279245; Pricing: 1=0.58, 10=0.371, 50=0.371, 100=0.289, 1000=0.267, 10000=0.267 (USD); Case/Package: 2512; Pins: 2; Weight: 0.002243oz; Case Code (Imperial): 2512; Case Code (Metric): 6432; Contact Plating: Tin,Matte; Min Operating Temperature: -65°C; Max Operating Temperature: 170°C; Tolerance: 1%; Power Rating: 1W; Packaging: Tape and Reel; Package Quantity: 2000; Termination: SMD/SMT; Resistor Type: Metal Strip; Features: Moisture Resistant,Automotive AEC-Q200,Anti-Sulfur; Series: WSL; Max Power Dissipation: 1W; Number of Terminations: 2; Resistance Tolerance: 1%; Technology: METAL STRIP; Length: 6.4mm; Width: 3.2mm; Height: 0.635mm; Depth: 3.18mm; Radiation Hardening: No; Reach SVHC Compliant: No; Lead Free: Lead Free; RoHS Compliant: No; ComponentLink1URL: https://datasheet.ciiva.com/11811/0900766b80d81e3e-11811295.pdf?src-supplier=Rs; ComponentLink1Description: https://datasheet.ciiva.com/11811/0900766b80d81e3e-11811295.pdf?src-supplier=Rs; ComponentLink2URL: https://datasheet.ciiva.com/6088/wsl-6088905.pdf?src-supplier=Farnell; ComponentLink2Description: https://datasheet.ciiva.com/6088/wsl-6088905.pdf?src-supplier=Farnell; ComponentLink3URL: https://datasheet.ciiva.com/9024/wsl-9024744.pdf?src-supplier=Avnet; ComponentLink3Description: https://datasheet.ciiva.com/9024/wsl-9024744.pdf?src-supplier=Avnet; ComponentLink4URL: https://datasheet.ciiva.com/22675/wsl-22675150.pdf?src-supplier=Element14; ComponentLink4Description: https://datasheet.ciiva.com/22675/wsl-22675150.pdf?src-supplier=Element14; ComponentLink5URL: https://datasheet.ciiva.com/16768/70201098-16768106.pdf?src-supplier=Allied+Electronics; ComponentLink5Description: https://datasheet.ciiva.com/16768/70201098-16768106.pdf?src-supplier=Allied+Electronics; ComponentLink6URL: https://datasheet.ciiva.com/7702/442550-7702460.pdf?src-supplier=Element14; ComponentLink6Description: https://datasheet.ciiva.com/7702/442550-7702460.pdf?src-supplier=Element14; ComponentLink7URL: https://datasheet.ciiva.com/7702/442550-7702461.pdf?src-supplier=Element14; ComponentLink7Description: https://datasheet.ciiva.com/7702/442550-7702461.pdf?src-supplier=Element14; ComponentLink8URL: https://datasheet.ciiva.com/9024/wsl-9024767.pdf?src-supplier=Avnet; ComponentLink8Description: https://datasheet.ciiva.com/9024/wsl-9024767.pdf?src-supplier=Avnet
R19 = 0603WAF1004T5E: 100mW Thick Film Resistors ±100ppm/℃ ±1% 1MΩ 0603 Chip Resistor - Surface Mount ROHS; Manufacturer: UNI-ROYAL(Uniroyal Elec); Manfacturer Part Number: 0603WAF1004T5E; LCSC Part Number: C22935; Package: 0603; Item Type: Resistor
R24 R29 = RC0603JR-07100KL: RES 100K OHM 5% 1/10W 0603; Manufacturer: Yageo; Resistance: 100kR; Temperature Coefficient: 100ppm/°C; Voltage Rating: 50V; Power Rating: 100mW; Item Type: Resistor; Supplier 1: Digi-Key; Manufacturer Part Number: RC0603JR-07100KL; RoHS: Yes; Category: Chip SMD Resistors; Stock 1: 1210037; Pricing 1: 1=0.10000, 10=0.02000, 100=0.00800, 1000=0.00360, 2500=0.00312 (USD); Case/Package: 0603; Number of Pins: 2; Contact Plating: Tin,Matte; Case Code (Imperial): 0603; Case Code (Metric): 1608; Size Code: 0603; Min Operating Temperature: -55°C; Max Operating Temperature: 155°C; Tolerance: 5%; Resistor Type: Thick Film; Packaging: Tape and Reel; Voltage Rating (DC): 50V; Termination: SMD/SMT; Features: Moisture Resistant; Series: RC; Max Power Dissipation: 100mW; Number of Terminations: 2; Resistance Tolerance: 5%; Width: 0.8mm; Radiation Hardening: No; REACH SVHC: No SVHC; Lead Free: Lead Free; RoHS Compliant: Yes; ComponentLink1URL: https://datasheet.ciiva.com/7746/443971-7746424.pdf?src-supplier=Element14; ComponentLink1Description: https://datasheet.ciiva.com/7746/443971-7746424.pdf?src-supplier=Element14; ComponentLink2URL: https://datasheet.ciiva.com/7983/443971-7983686.pdf?src-supplier=Element14; ComponentLink2Description: https://datasheet.ciiva.com/7983/443971-7983686.pdf?src-supplier=Element14; ComponentLink3URL: https://datasheet.ciiva.com/7746/443971-7746423.pdf?src-supplier=Element14; ComponentLink3Description: https://datasheet.ciiva.com/7746/443971-7746423.pdf?src-supplier=Element14; ComponentLink4URL: https://datasheet.ciiva.com/8887/pyu-rc0603-51-rohs-l-4-8887903.pdf?src-supplier=Avnet; ComponentLink4Description: https://datasheet.ciiva.com/8887/pyu-rc0603-51-rohs-l-4-8887903.pdf?src-supplier=Avnet; Supplier Part Number 1: 311-100KGRCT-ND; LCSC Part Number: C100048
R25 = LR1206-21R040F4: 1W 40mΩ Surface Mount Current Sensing Resistors ±50ppm/℃ ±1% 1206 Current Sense Resistors/Shunt Resistors ROHS; Manufacturer: RALEC; Manufacturer Part Number: LR1206-21R040F4; Package: 1206; LCSC Part Number: C2681030; Item Type: Resistor; ComponentLink1Description: LCSC; ComponentLink1URL: https://www.lcsc.com/product-detail/Current-Sense-Resistors-Shunt-Resistors_RALEC-LR1206-21R040F4_C2681030.html
R26 = RC0603FR-0756KL: RES 56K OHM 1% 1/10W 0603; Manufacturer: Yageo; Voltage Rating (DC): 50V; Resistance: 56kR; Power Rating: 100mW; Temperature Coefficient: 100ppm/°C; Voltage Rating: 75V; Manufacturer Part Number: RC0603FR-0756KL; Package: 0603; Value: 56K; Supplier 1: RSComponents; RoHS: Yes; Category: Chip SMD Resistors; Stock 1: 15000; Pricing 1: 100=0.01300, 500=0.01200, 1000=0.01100, 2500=0.01000, 5000=0.00900 (GBP); Case/Package: 0603; Number of Pins: 2; Case Code (Metric): 1608; Case Code (Imperial): 0603; Weight: 7.1E-05oz; Size Code: 0603; Min Operating Temperature: -55°C; Max Operating Temperature: 155°C; Tolerance: 1%; Packaging: Tape and Reel; Package Quantity: 1; Resistor Type: Thick Film; Number of Terminations: 2; Termination: SMD/SMT; Max Power Dissipation: 100mW; Features: Moisture Resistant; Series: RC; Resistance Tolerance: 1%; Construction: Rectangular; Length: 1.6mm; Width: 0.8mm; Height: 0.022inch; Depth: 0.8mm; Reach SVHC Compliant: Unknown; Lead Free: Lead Free; Military Standard: Not; RoHS Compliant: Yes; ComponentLink1URL: https://datasheet.ciiva.com/2508/pyu-r-int-thick-7-2508519.pdf?src-supplier=Digi-Key; ComponentLink1Description: https://datasheet.ciiva.com/2508/pyu-r-int-thick-7-2508519.pdf?src-supplier=Digi-Key; ComponentLink2URL: https://datasheet.ciiva.com/2508/pyu-r-int-thick-7-2508520.pdf?src-supplier=Digi-Key; ComponentLink2Description: https://datasheet.ciiva.com/2508/pyu-r-int-thick-7-2508520.pdf?src-supplier=Digi-Key; ComponentLink3URL: https://datasheet.ciiva.com/2508/pyu-r-int-thick-7-2508518.pdf?src-supplier=Digi-Key; ComponentLink3Description: https://datasheet.ciiva.com/2508/pyu-r-int-thick-7-2508518.pdf?src-supplier=Digi-Key; ComponentLink4URL: https://datasheet.ciiva.com/7746/443971-7746377.pdf?src-supplier=Element14; ComponentLink4Description: https://datasheet.ciiva.com/7746/443971-7746377.pdf?src-supplier=Element14; ComponentLink5URL: https://datasheet.ciiva.com/7746/443971-7746376.pdf?src-supplier=Element14; ComponentLink5Description: https://datasheet.ciiva.com/7746/443971-7746376.pdf?src-supplier=Element14; ComponentLink6URL: https://datasheet.ciiva.com/15189/getdatasheetpartid-329310-15189781.pdf?src-supplier=Verical; ComponentLink6Description: https://datasheet.ciiva.com/15189/getdatasheetpartid-329310-15189781.pdf?src-supplier=Verical; Supplier Part Number 1: 1995607; LCSC Part Number: C114630
S1 = SM0320102: SWITCH SLIDE SPDT 500MA 12V; Manufacturer: NKK Switches; Item Type: Slide Switches; Supplier: Digikey; Supplier Part Number: 360-2920-ND; Manufacturer Part Number: SM0320102; RoHS: Yes; Stock: 1371; Pricing: 1=4.7, 10=4.507, 25=4.1148, 100=3.5661, 250=3.233, 500=2.99788, 1000=2.78235, 2500=2.52762 (USD); ComponentLink1URL: https://datasheet.ciiva.com/5279/smslides-23398-5279864.pdf?src-supplier=Mouser; ComponentLink1Description: https://datasheet.ciiva.com/5279/smslides-23398-5279864.pdf?src-supplier=Mouser; ComponentLink2URL: https://datasheet.ciiva.com/28378/1783589-28378567.pdf?src-supplier=Element14; ComponentLink2Description: https://datasheet.ciiva.com/28378/1783589-28378567.pdf?src-supplier=Element14; ComponentLink3URL: https://datasheet.ciiva.com/16359/msnonilluminated-16359931.pdf?src-supplier=Future+Electronics; ComponentLink3Description: https://datasheet.ciiva.com/16359/msnonilluminated-16359931.pdf?src-supplier=Future+Electronics
U1 = LM1117S-5.0: 75dB@(120Hz) 1A Fixed 5V Positive electrode 12V SOT-223-3 Linear Voltage Regulators (LDO) ROHS; Manufacturer: HTC Korea TAEJIN Tech; Manufacturer Part Number: LM1117S-5.0; Package: SOT-223-3; LCSC Part Number: C126028; Item Type: LDO; ComponentLink1Description: LCSC; ComponentLink1URL: https://www.lcsc.com/product-detail/Linear-Voltage-Regulators-LDO_HTC-Korea-TAEJIN-Tech-LM1117S-5-0_C126028.html
U2 = OKL-T/6-W12P-C: DC DC CONVERTER 0.591-5.5V 30W; Manufacturer: Murata; Item Type: Board Mount Modules; Supplier: Digikey; Supplier Part Number: 811-3015-1-ND; Manufacturer Part Number: OKL-T/6-W12P-C; RoHS: Yes; Stock: 5709; Pricing: 1=6.48, 5=6.39, 10=6.298, 25=6.1128, 50=5.9274, 100=5.7423 (USD); ComponentLink1URL: https://datasheet.ciiva.com/4644/okl-t6-w12-21493-4644197.pdf?src-supplier=Mouser; ComponentLink1Description: https://datasheet.ciiva.com/4644/okl-t6-w12-21493-4644197.pdf?src-supplier=Mouser
U3 = LTC4010CFE#PBF: IC BATT CHG MULTI 1-16C 16TSSOP; Manufacturer: Analog Devices / Linear Technology; Number of Cells: 16; Min Supply Voltage: 4.5V; Max Supply Voltage: 34V; Max Output current: 2A; Max Output Voltage: 4.8V; Max Charge Current: 4A; Supplier: Mouser; Supplier Part Number: 584-LTC4010CFE#PBF; Manufacturer Part Number: LTC4010CFE#PBF; RoHS: Yes; Item Type: IC; Stock: 18708; Pricing: 1=11.41, 10=10.48, 50=10.05, 100=8.65, 1000=7.22, 10000=7.21 (USD); Case/Package: TSSOP; Pins: 16; Min Operating Temperature: 0°C; Max Operating Temperature: 85°C; Package Quantity: 95; Packaging: Rail/Tube; Min Input Voltage: 4.5V; Min Output Voltage: 4.5V; Termination: SMD/SMT; Series: -; Length: 5.1mm; Width: 4.5mm; Height: 0.95mm; Radiation Hardening: No; Reach SVHC Compliant: No; Lead Free: Lead Free; RoHS Compliant: Yes; ComponentLink1URL: https://datasheet.ciiva.com/14093/drlinear-batterie-lade-ic-ltc14010-en-14093937.pdf?src-supplier=Distrelec; ComponentLink1Description: https://datasheet.ciiva.com/14093/drlinear-batterie-lade-ic-ltc14010-en-14093937.pdf?src-supplier=Distrelec; ComponentLink2URL: https://datasheet.ciiva.com/25627/0900766b810edb64-25627723.pdf?src-supplier=Rs; ComponentLink2Description: https://datasheet.ciiva.com/25627/0900766b810edb64-25627723.pdf?src-supplier=Rs; ComponentLink3URL: https://datasheet.ciiva.com/15114/getdatasheetpartid-136155-15114456.pdf?src-supplier=Verical; ComponentLink3Description: https://datasheet.ciiva.com/15114/getdatasheetpartid-136155-15114456.pdf?src-supplier=Verical; ComponentLink4URL: https://datasheet.ciiva.com/19478/1759060-19478598.pdf?src-supplier=Jameco; ComponentLink4Description: https://datasheet.ciiva.com/19478/1759060-19478598.pdf?src-supplier=Jameco; ComponentLink5URL: https://datasheet.ciiva.com/1934/6917-1934212.pdf?src-supplier=Digikey; ComponentLink5Description: https://datasheet.ciiva.com/1934/6917-1934212.pdf?src-supplier=Digikey; ComponentLink6URL: https://datasheet.ciiva.com/1490/1675706-1490082.pdf?src-supplier=Element14; ComponentLink6Description: https://datasheet.ciiva.com/1490/1675706-1490082.pdf?src-supplier=Element14; ComponentLink7URL: https://datasheet.ciiva.com/1137/1675706-1137371.pdf?src-supplier=Element14; ComponentLink7Description: https://datasheet.ciiva.com/1137/1675706-1137371.pdf?src-supplier=Element14; ComponentLink8URL: https://datasheet.ciiva.com/1139/1675706-1139885.pdf?src-supplier=Farnell; ComponentLink8Description: https://datasheet.ciiva.com/1139/1675706-1139885.pdf?src-supplier=Farnell; ComponentLink9URL: https://datasheet.ciiva.com/1496/1675706-1496804.pdf?src-supplier=Farnell; ComponentLink9Description: https://datasheet.ciiva.com/1496/1675706-1496804.pdf?src-supplier=Farnell
U7 U13 U15 = FDS4435A: SOIC-8 MOSFETs ROHS; Manufacturer: TECH PUBLIC; Item Type: Mosfet; Manufacturer Part Number: FDS4435A; Package: SOIC-8; LCSC Part Number: C5122021; ComponentLink1Description: LCSC; ComponentLink1URL: https://www.lcsc.com/product-detail/MOSFETs_TECH-PUBLIC-FDS4435A_C5122021.html
U9 = MAX662AESA+T: IC REG CHRG PUMP 12V 30MA 8SOIC; Manufacturer: Maxim; Supplier: Mouser; Supplier Part Number: 700-MAX662AESAT; Manufacturer Part Number: MAX662AESA+T; RoHS: Yes; Item Type: IC; Stock: 14227; Pricing: 1=7.55, 10=6.82, 50=6.51, 100=5.65, 1000=4.34, 10000=4.34 (USD); ComponentLink1URL: https://datasheet.ciiva.com/3216/max662a-3216150.pdf?src-supplier=Avnet; ComponentLink1Description: https://datasheet.ciiva.com/3216/max662a-3216150.pdf?src-supplier=Avnet; ComponentLink2URL: https://datasheet.ciiva.com/3216/max662a-3216729.pdf?src-supplier=Avnet; ComponentLink2Description: https://datasheet.ciiva.com/3216/max662a-3216729.pdf?src-supplier=Avnet; ComponentLink3URL: https://datasheet.ciiva.com/2037/max662a-2037379.pdf?src-supplier=Digikey; ComponentLink3Description: https://datasheet.ciiva.com/2037/max662a-2037379.pdf?src-supplier=Digikey; LCSC Part Number: C2976348